# EasyEDA Pro project WT_VCO_open.epro

# Schematic WT VCO

## Sheets
1 P1: Board Name: Board1; Create Date: 2026-09-29; Page Name: P1; Project Name: Dual WT; Schematic Name: Schematic1; Update Date: 2026-09-29; Company: Shota Azuma; Drawn: Shota Azuma; Page Size: A4; Reviewed: Shota Azuma; Version: V1.0
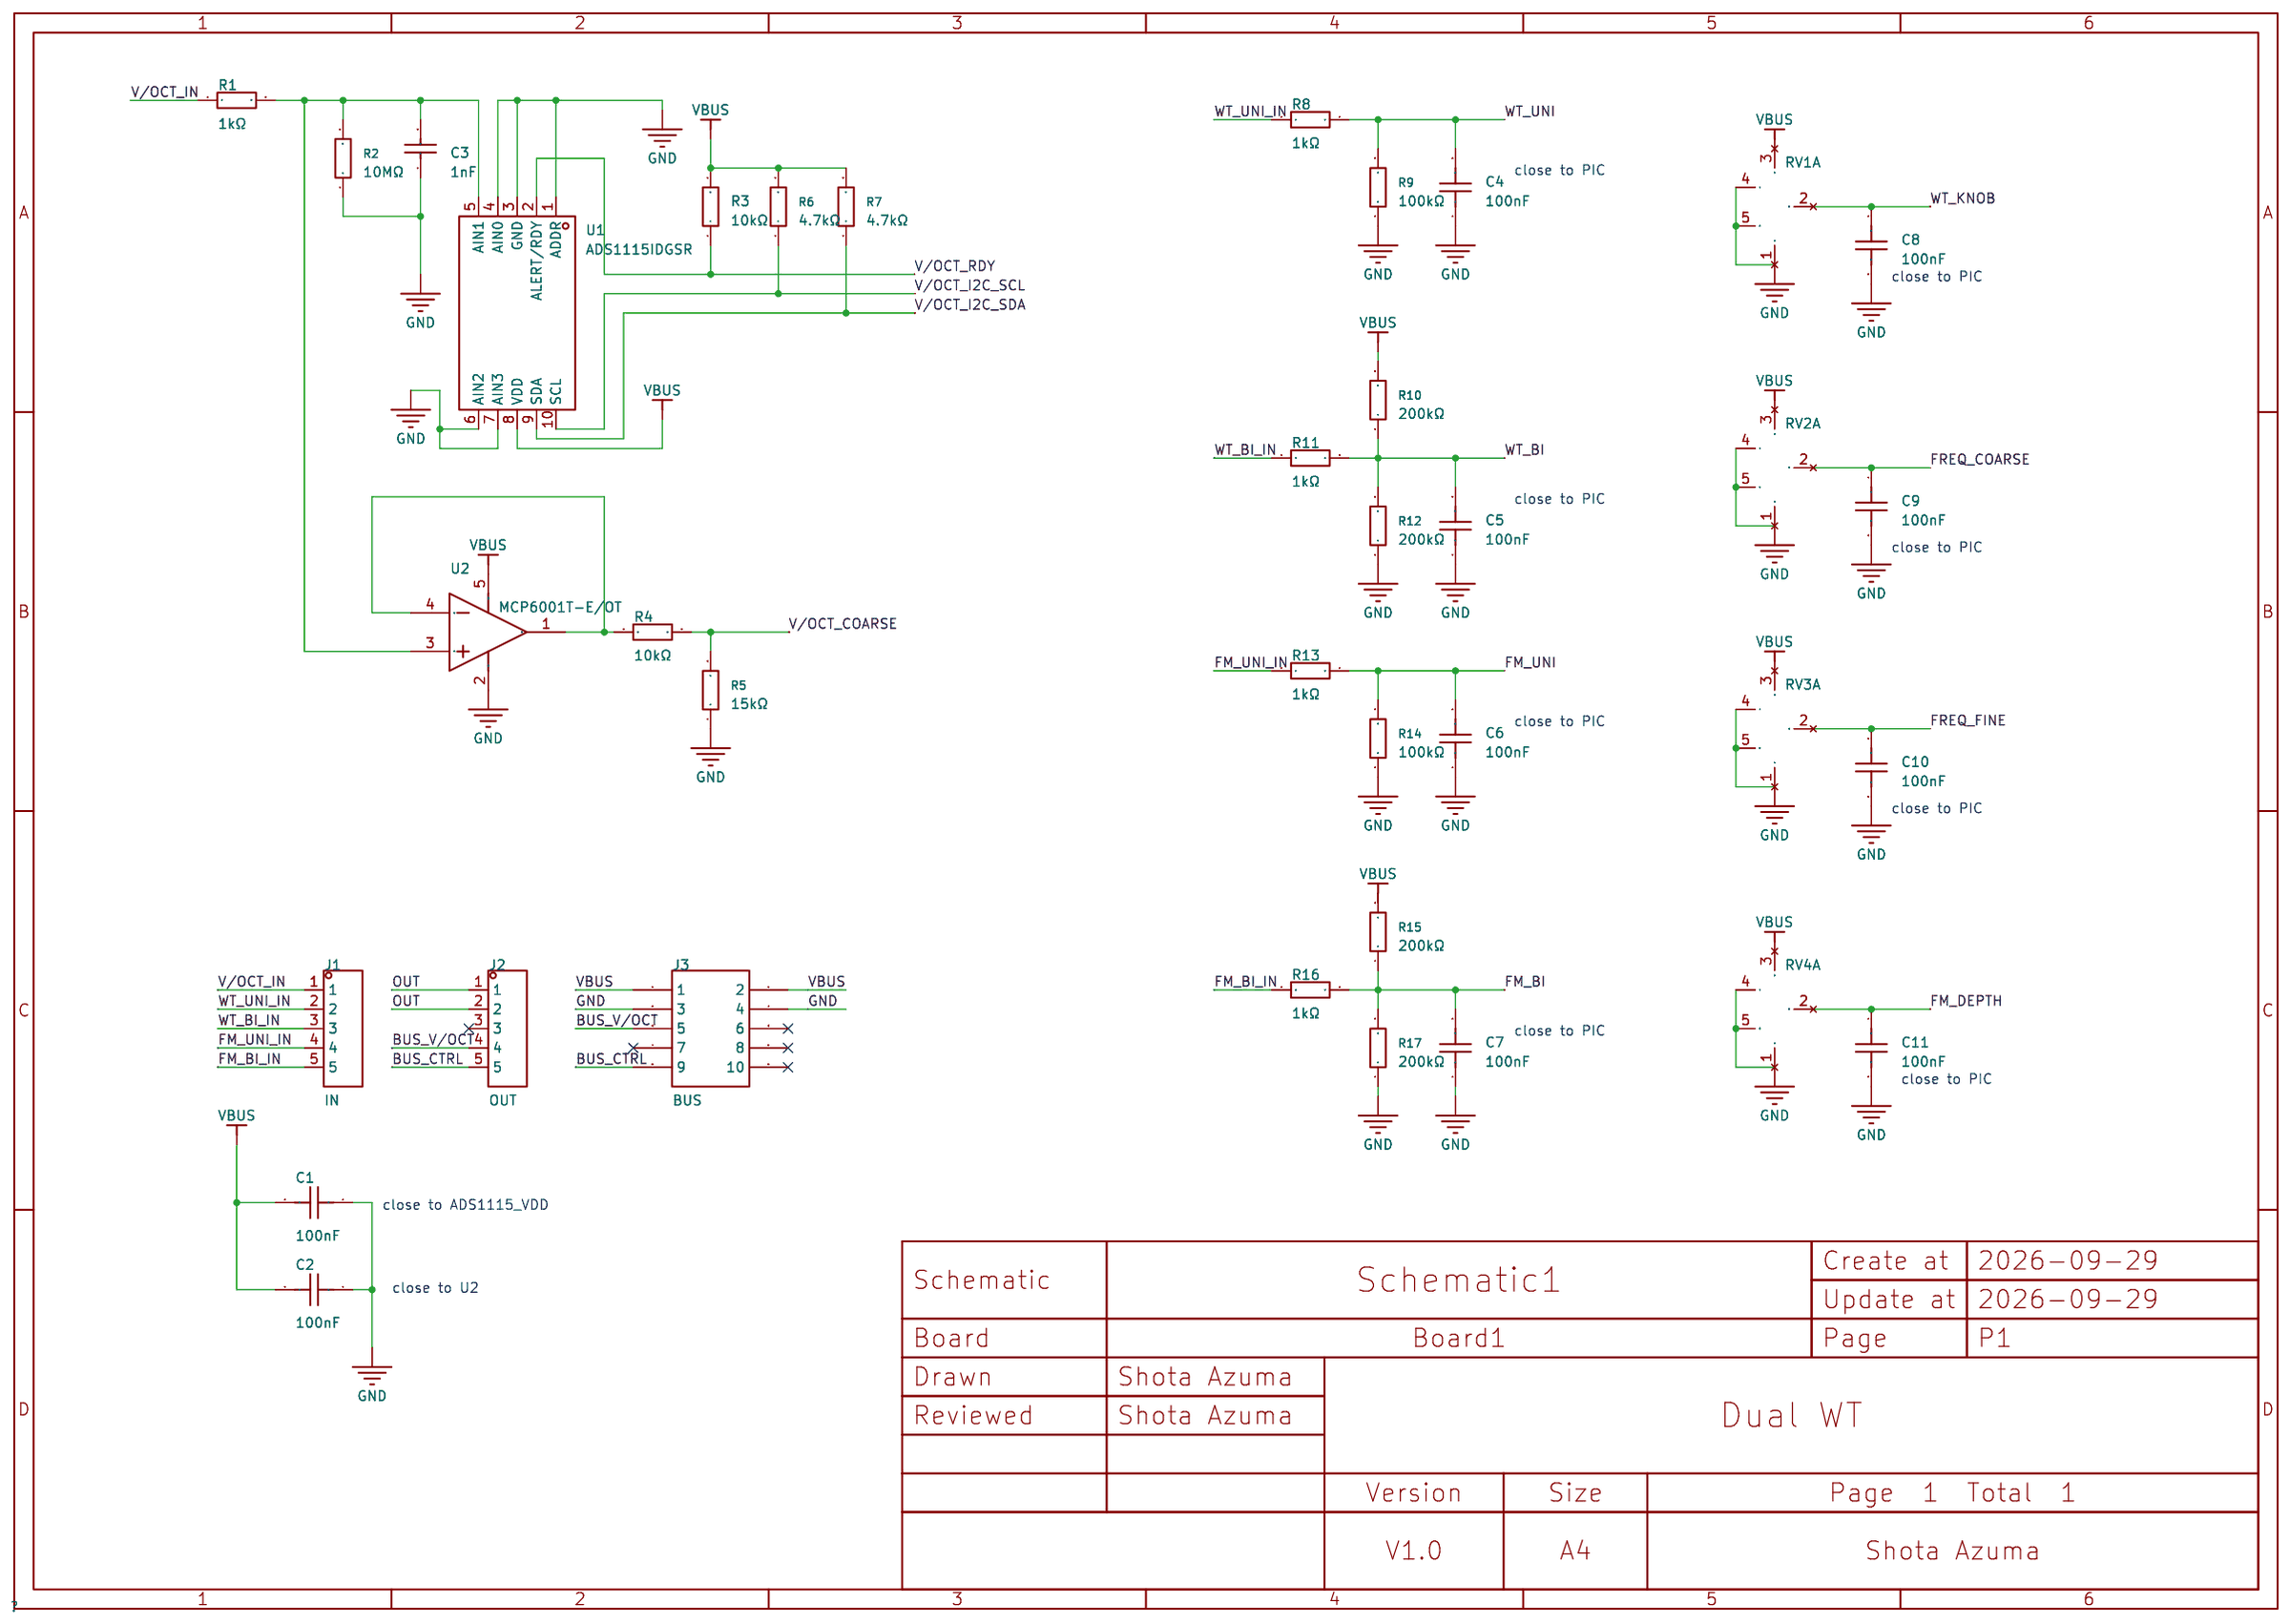
[diagram p0: P1]
2 P2: Page Name: P2
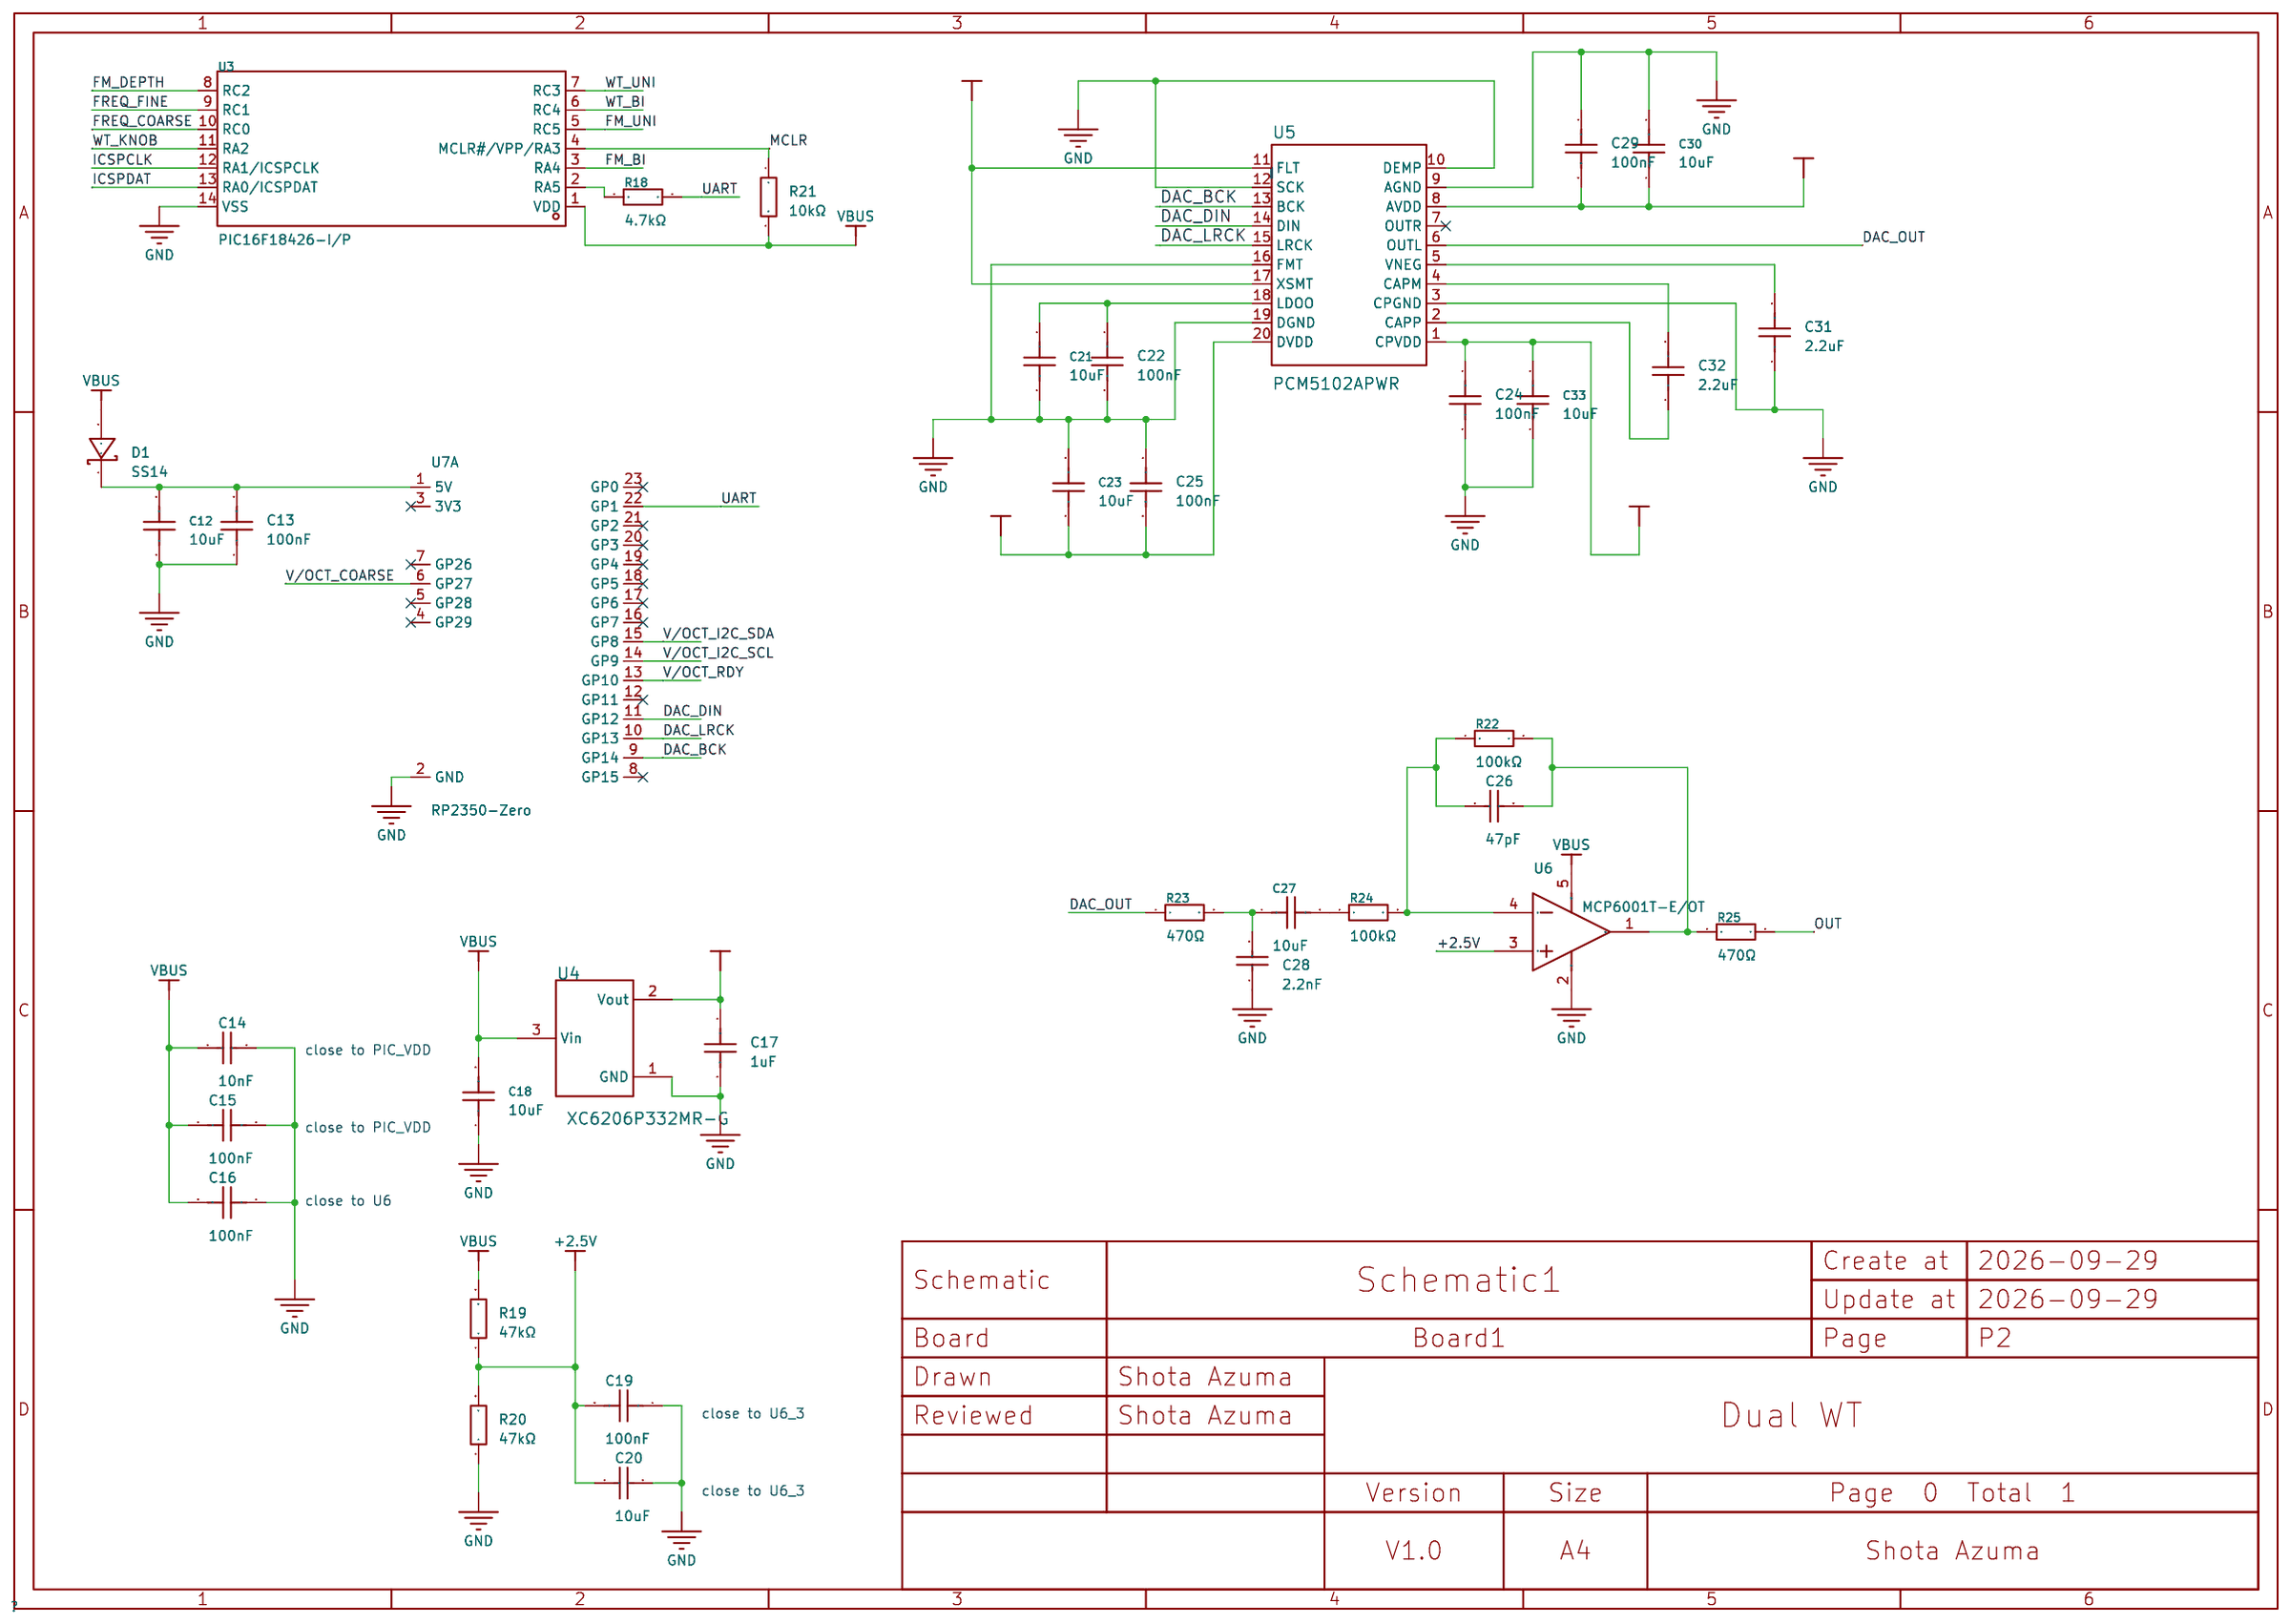
[diagram p1: P2]

## Parts
sheet P1
C1  100nF  [C0402]
C2  100nF  [C0402]
C3  1nF  [C0402]
C4  100nF  [C0402]
C5  100nF  [C0402]
C6  100nF  [C0402]
C7  100nF  [C0402]
C8  100nF  [C0402]
C9  100nF  [C0402]
C10  100nF  [C0402]
C11  100nF  [C0402]
J1  IN  [HDR-TH_5P-P2.54-V-M]  (no BOM)
J2  OUT  [HDR-TH_5P-P2.54-V-M]  (no BOM)
J3  BUS  [HDR-TH_10P-P2.54-V-F-R2-C5-S2.54]  (no BOM)
R1  1kΩ  [R0402]
R2  10MΩ  [R0603]
R3  10kΩ  [R0402]
R4  10kΩ  [R0402]
R5  15kΩ  [R0402]
R6  4.7kΩ  [R0402]
R7  4.7kΩ  [R0402]
R8  1kΩ  [R0402]
R9  100kΩ  [R0402]
R10  200kΩ  [R0402]
R11  1kΩ  [R0402]
R12  200kΩ  [R0402]
R13  1kΩ  [R0402]
R14  100kΩ  [R0402]
R15  200kΩ  [R0402]
R16  1kΩ  [R0402]
R17  200kΩ  [R0402]
RV1  -  [ALPS_RK09K_Vertical]  (section 1)  (no BOM)
RV2  -  [ALPS_RK09K_Vertical]  (section 1)  (no BOM)
RV3  -  [ALPS_RK09K_Vertical]  (section 1)  (no BOM)
RV4  -  [ALPS_RK09K_Vertical]  (section 1)  (no BOM)
U1  ADS1115IDGSR  [MSOP-10_L3.0-W3.0-P0.50-LS5.0-BL]
U2  MCP6001T-E/OT  [SOT-23-5_L3.0-W1.7-P0.95-LS2.8-BR]
sheet P2
C12  10uF  [C0603]
C13  100nF  [C0402]
C14  10nF  [C0402]
C15  100nF  [C0402]
C16  100nF  [C0402]
C17  1uF  [C0402]
C18  10uF  [C0603]
C19  100nF  [C0402]
C20  10uF  [C0402]
C21  10uF  [C0603]
C22  100nF  [C0402]
C23  10uF  [C0603]
C24  100nF  [C0402]
C25  100nF  [C0402]
C26  47pF  [C0402]
C27  10uF  [C0603]
C28  2.2nF  [C0603]
C29  100nF  [C0402]
C30  10uF  [C0603]
C31  2.2uF  [C0805]
C32  2.2uF  [C0805]
C33  10uF  [C0603]
D1  SS14  [SMA_L4.2-W2.6-LS5.0-RD_1]
R18  4.7kΩ  [R0402]
R19  47kΩ  [R0402]
R20  47kΩ  [R0402]
R21  10kΩ  [R0402]
R22  100kΩ  [R0402]
R23  470Ω  [R0402]
R24  100kΩ  [R0402]
R25  470Ω  [R0402]
U3  PIC16F18426-I/P  [PDIP-14_L19.7-W6.6-P2.54-LS8.3-BL]  (no BOM)
U4  XC6206P332MR-G  [SOT-23-3_L2.9-W1.6-P1.90-LS2.8-BR]
U5  PCM5102APWR  [TSSOP-20_L6.5-W4.4-P0.65-LS6.4-BL]
U6  MCP6001T-E/OT  [SOT-23-5_L3.0-W1.7-P0.95-LS2.8-BR]
U7  RP2350-Zero  [RP2350-Zero]  (section 1)  (no BOM)

## Library data of the parts
C1 C2 C4-C11 C13 C15 C16 C19 C22 C24 C25 C29 = CL05B104KB54PNC: Capacitance:100nF Tolerance:±10% Tolerance:±10% Voltage Rating:50V Temperature Coefficient:X7R; LCSC Part Name: 100nF ±10% 50V; Supplier Part: C307331; Manufacturer: SAMSUNG(三星); Supplier Footprint: 0402; JLCPCB Part Class: Basic Part; Datasheet: https://item.szlcsc.com/datasheet/CL05B104KB54PNC/291005.html; Supplier: LCSC; Tolerance: ±10%; Voltage Rating: 50V; Temperature Coefficient: X7R
C3 = 0402B102K500NT: Capacitance:1nF Tolerance:±10% Tolerance:±10% Voltage Rating:50V Temperature Coefficient:X7R; LCSC Part Name: 1nF ±10% 50V; Supplier Part: C1523; Manufacturer: FH(风华); Supplier Footprint: 0402; JLCPCB Part Class: Basic Part; Datasheet: https://item.szlcsc.com/datasheet/0402B102K500NT/1875.html; Supplier: LCSC; Tolerance: ±10%; Voltage Rating: 50V; Temperature Coefficient: X7R
J1 J2 = HDR-M_2.54_1x5P: Supplier Footprint: Through
J3 = HDR-F_2.54_2x5: Supplier Footprint: Through; Supplier Part: HDR-F-2.54_2x5.1
R1 R8 R11 R13 R16 = 0402WGF1001TCE: Type:Thick Film Resistor Resistance:1kΩ Tolerance:±1% Tolerance:±1% Power(Watts):62.5mW Voltage-Supply(Max):50V Temperature Coefficient:±100ppm/℃ Temperature Coefficient:±100ppm/℃ Operating Temperature:-55℃~+155℃ Operating Temperature:-55℃~+155℃; LCSC Part Name: 厚膜电阻 1kΩ ±1%; Supplier Part: C11702; Manufacturer: UNI-ROYAL(厚声); Supplier Footprint: 0402; JLCPCB Part Class: Basic Part; Datasheet: https://item.szlcsc.com/datasheet/0402WGF1001TCE/12256.html; Supplier: LCSC; Type: Thick Film Resistor; Tolerance: ±1%; Power(Watts): 62.5mW; Voltage-Supply(Max): 50V; Temperature Coefficient: ±100ppm/℃; Operating Temperature: -55℃~+155℃
R2 = 0603WAF1005T5E: Type:Thick Film Resistor Resistance:10MΩ Tolerance:±1% Tolerance:±1% Power(Watts):100mW Voltage-Supply(Max):75V Temperature Coefficient:±100ppm/℃ Temperature Coefficient:±100ppm/℃ Operating Temperature:-55℃~+155℃ Operating Temperature:-55℃~+155℃; LCSC Part Name: 厚膜电阻 10MΩ ±1%; Supplier Part: C7250; Manufacturer: UNI-ROYAL(厚声); Supplier Footprint: 0603; JLCPCB Part Class: Basic Part; Datasheet: https://item.szlcsc.com/datasheet/0603WAF1005T5E/7726.html; Supplier: LCSC; Type: Thick Film Resistor; Tolerance: ±1%; Power(Watts): 100mW; Voltage-Supply(Max): 75V; Temperature Coefficient: ±100ppm/℃; Operating Temperature: -55℃~+155℃
R3 R4 R21 = 0402WGF1002TCE: Type:Thick Film Resistor Resistance:10kΩ Tolerance:±1% Tolerance:±1% Power(Watts):62.5mW Voltage-Supply(Max):50V Temperature Coefficient:±100ppm/℃ Temperature Coefficient:±100ppm/℃ Operating Temperature:-55℃~+155℃ Operating Temperature:-55℃~+155℃; LCSC Part Name: 厚膜电阻 10kΩ ±1%; Supplier Part: C25744; Manufacturer: UNI-ROYAL(厚声); Supplier Footprint: 0402; JLCPCB Part Class: Basic Part; Datasheet: https://item.szlcsc.com/datasheet/0402WGF1002TCE/26487.html; Supplier: LCSC; Type: Thick Film Resistor; Tolerance: ±1%; Power(Watts): 62.5mW; Voltage-Supply(Max): 50V; Temperature Coefficient: ±100ppm/℃; Operating Temperature: -55℃~+155℃
R5 = 0402WGF1502TCE: Type:Thick Film Resistors Resistance:15kΩ Tolerance:±1% Tolerance:±1% Power(Watts): Overload Voltage (Max): Temperature Coefficient:±100ppm/℃ Temperature Coefficient:±100ppm/℃ Operating Temperature Range:-55℃~+155℃ Operating Temperature Range:-55℃~+155℃; LCSC Part Name: 15kΩ ±1% 62.5mW 厚膜电阻; Supplier Part: C25756; Manufacturer: UNI-ROYAL(厚声); Supplier Footprint: 0402; JLCPCB Part Class: Basic Part; Datasheet: https://atta.szlcsc.com/upload/public/pdf/source/20200306/C422600_1E6D84923E4A46A82E41ADD87F860B5C.pdf; Supplier: LCSC; Type: Thick Film Resistors; Tolerance: ±1%; Temperature Coefficient: ±100ppm/℃; Operating Temperature Range: -55℃~+155℃
R6 R7 R18 = 0402WGF4701TCE: Type:Thick Film Resistor Resistance:4.7kΩ Tolerance:±1% Tolerance:±1% Power(Watts):62.5mW Voltage-Supply(Max):50V Temperature Coefficient:±100ppm/℃ Temperature Coefficient:±100ppm/℃ Operating Temperature:-55℃~+155℃ Operating Temperature:-55℃~+155℃; LCSC Part Name: 厚膜电阻 4.7kΩ ±1%; Supplier Part: C25900; Manufacturer: UNI-ROYAL(厚声); Supplier Footprint: 0402; JLCPCB Part Class: Basic Part; Datasheet: https://item.szlcsc.com/datasheet/0402WGF4701TCE/26643.html; Supplier: LCSC; Type: Thick Film Resistor; Tolerance: ±1%; Power(Watts): 62.5mW; Voltage-Supply(Max): 50V; Temperature Coefficient: ±100ppm/℃; Operating Temperature: -55℃~+155℃
R9 R14 R22 R24 = 0402WGF1003TCE: Type:Thick Film Resistor Resistance:100kΩ Tolerance:±1% Tolerance:±1% Power(Watts):62.5mW Voltage-Supply(Max):50V Temperature Coefficient:±100ppm/℃ Temperature Coefficient:±100ppm/℃ Operating Temperature:-55℃~+155℃ Operating Temperature:-55℃~+155℃; LCSC Part Name: 厚膜电阻 100kΩ ±1%; Supplier Part: C25741; Manufacturer: UNI-ROYAL(厚声); Supplier Footprint: 0402; JLCPCB Part Class: Basic Part; Datasheet: https://item.szlcsc.com/datasheet/0402WGF1003TCE/26484.html; Supplier: LCSC; Type: Thick Film Resistor; Tolerance: ±1%; Power(Watts): 62.5mW; Voltage-Supply(Max): 50V; Temperature Coefficient: ±100ppm/℃; Operating Temperature: -55℃~+155℃
R10 R12 R15 R17 = 0402WGF2003TCE: Type:Thick Film Resistor Resistance:200kΩ Tolerance:±1% Tolerance:±1% Power(Watts):62.5mW Voltage-Supply(Max):50V Temperature Coefficient:±100ppm/℃ Temperature Coefficient:±100ppm/℃ Operating Temperature:-55℃~+155℃ Operating Temperature:-55℃~+155℃; LCSC Part Name: 200kΩ ±1% 62.5mW 厚膜电阻; Supplier Part: C25764; Manufacturer: UNI-ROYAL(厚声); Supplier Footprint: 0402; JLCPCB Part Class: Basic Part; Datasheet: https://item.szlcsc.com/datasheet/0402WGF2003TCE/26507.html; Supplier: LCSC; Type: Thick Film Resistor; Tolerance: ±1%; Power(Watts): 62.5mW; Voltage-Supply(Max): 50V; Temperature Coefficient: ±100ppm/℃; Operating Temperature: -55℃~+155℃
RV1-RV4 = ALPS_RK09K_Vertical: ALPS ALPINE RK09K series 9mm rotary potentiometer, vertical PCB mount; Manufacturer: ALPS ALPINE
U1 = ADS1115IDGSR: Resolution (Bits):16 Sampling Rate:860Hz number of channels:2 Voltage - Supply:2V~5.5V Voltage - Supply:2V~5.5V Interface:I2C differential input:Yes Integral non - linearity:1LSB Integral non - linearity:1LSB Operating Temperature:-40℃~+125℃ Operating Tem; LCSC Part Name: 具有内部基准、振荡器和可编程比较器且兼容 I2C 的ADS111x、超小型、低功耗 860SPS、16位ADC; Supplier Part: C37593; Manufacturer: TI(德州仪器); Supplier Footprint: VSSOP-10; JLCPCB Part Class: Extended Part; Datasheet: https://www.ti.com/cn/lit/ds/symlink/ads1115.pdf; Supplier: LCSC; Resolution (Bits): 16; Sampling Rate: 860Hz; number of channels: 2; Voltage - Supply: 2V~5.5V; Interface: I2C; differential input: Yes; Integral non - linearity: 1LSB; Operating Temperature: -40℃~+125℃; Clock/Oscillator: Built-in; Voltage Reference: Built-in; Programmable Gain: Support; ADC architecture: Sigma-Delta; Quiescent Current (Iq): 500nA; Features: Integrated modulator；Multiplexers；Built-in digital filter；Power-on reset
U2 U6 = MCP6001T-E/OT: Number of Channels:1 Rail to Rail:Rail-to-Rail Input, Rail-to-Rail Output Gain Bandwidth Product:1MHz Vos - Input Offset Voltage:4.5mV Input Offset Voltage Drift(Vos TC):2uV/℃ Slew Rate:600V/ms Ib - Input Bias Current:1pA Input Offset Current(Ios):1pA Inp; LCSC Part Name: 1 MHz 低功耗运算放大器; Supplier Part: C29429; Manufacturer: MICROCHIP(美国微芯); Supplier Footprint: SOT-23-5; JLCPCB Part Class: Extended Part; Datasheet: https://item.szlcsc.com/datasheet/MCP6001T-E%252FOT/30183.html; Supplier: LCSC; Number of Channels: 1; Rail to Rail: Rail-to-Rail Input, Rail-to-Rail Output; Gain Bandwidth Product: 1MHz; Vos - Input Offset Voltage: 4.5mV; Input Offset Voltage Drift(Vos TC): 2uV/℃; Slew Rate: 600V/ms; Ib - Input Bias Current: 1pA; Input Offset Current(Ios): 1pA; Input Voltage Noise Density: 28nV/√Hz@1kHz; Common Mode Rejection Ratio(CMRR): 76dB; Quiescent Current: 100uA; Output Current: 23mA; Operating Temperature: -40℃~+125℃; Single supply: 1.8V~6V; Features: ESD protection
C12 C18 C21 C23 C27 C30 C33 = CL10A106MA8NRNC: Capacitance:10uF Tolerance:±20% Tolerance:±20% Voltage Rating:25V Temperature Coefficient:X5R; LCSC Part Name: 10uF ±20% 25V; Supplier Part: C96446; Manufacturer: SAMSUNG(三星); Supplier Footprint: 0603; JLCPCB Part Class: Basic Part; Datasheet: https://item.szlcsc.com/datasheet/CL10A106MA8NRNC/97651.html; Supplier: LCSC; Tolerance: ±20%; Voltage Rating: 25V; Temperature Coefficient: X5R
C14 = CL05B103KB5NNNC: Capacitance:10nF Tolerance:±10% Tolerance:±10% Voltage Rating:50V Temperature Coefficient:X7R; LCSC Part Name: 10nF ±10% 50V; Supplier Part: C15195; Manufacturer: SAMSUNG(三星); Supplier Footprint: 0402; JLCPCB Part Class: Basic Part; Datasheet: https://item.szlcsc.com/datasheet/CL05B103KB5NNNC/15869.html; Supplier: LCSC; Tolerance: ±10%; Voltage Rating: 50V; Temperature Coefficient: X7R
C17 = CL05A105KA5NQNC: Capacitance:1uF Tolerance:±10% Tolerance:±10% Voltage Rating:25V Temperature Coefficient:X5R; LCSC Part Name: 1uF ±10% 25V; Supplier Part: C52923; Manufacturer: SAMSUNG(三星); Supplier Footprint: 0402; JLCPCB Part Class: Basic Part; Datasheet: https://item.szlcsc.com/datasheet/CL05A105KA5NQNC/53938.html; Supplier: LCSC; Tolerance: ±10%; Voltage Rating: 25V; Temperature Coefficient: X5R
C20 = CL05A106MQ5NUNC: Capacitance:10uF Tolerance:±20% Tolerance:±20% Voltage Rating:6.3V Temperature Coefficient:X5R; LCSC Part Name: 10uF ±20% 6.3V; Supplier Part: C15525; Manufacturer: SAMSUNG(三星); Supplier Footprint: 0402; JLCPCB Part Class: Basic Part; Datasheet: https://item.szlcsc.com/datasheet/CL05A106MQ5NUNC/16204.html; Supplier: LCSC; Tolerance: ±20%; Voltage Rating: 6.3V; Temperature Coefficient: X5R
C26 = 0402CG470J500NT: Capacitance:47pF Tolerance:±5% Tolerance:±5% Voltage Rating:50V Temperature Coefficient:C0G; LCSC Part Name: 47pF ±5% 50V; Supplier Part: C1567; Manufacturer: FH(风华); Supplier Footprint: 0402; JLCPCB Part Class: Basic Part; Datasheet: https://item.szlcsc.com/datasheet/0402CG470J500NT/1919.html; Supplier: LCSC; Tolerance: ±5%; Voltage Rating: 50V; Temperature Coefficient: C0G
C28 = 0603B222K500NT: Capacitance:2.2nF Tolerance:±10% Tolerance:±10% Voltage Rating:50V Temperature Coefficient:X7R; LCSC Part Name: 2.2nF ±10% 50V; Supplier Part: C1604; Manufacturer: FH(风华); Supplier Footprint: 0603; JLCPCB Part Class: Basic Part; Datasheet: https://item.szlcsc.com/datasheet/0603B222K500NT/1956.html; Supplier: LCSC; Tolerance: ±10%; Voltage Rating: 50V; Temperature Coefficient: X7R
C31 C32 = CL21A225KBQNNNE: Capacitance:2.2uF Tolerance:±10% Tolerance:±10% Voltage Rating:50V Temperature Coefficient:X5R; LCSC Part Name: 2.2uF ±10% 50V; Supplier Part: C377773; Manufacturer: SAMSUNG(三星); Supplier Footprint: 0805; JLCPCB Part Class: Basic Part; Datasheet: https://item.szlcsc.com/datasheet/CL21A225KBQNNNE/350246.html; Supplier: LCSC; Tolerance: ±10%; Voltage Rating: 50V; Temperature Coefficient: X5R
D1 = SS14_C2480: Diode Configuration:Independent Voltage - Forward(Vf@If):550mV@1A Voltage - DC Reverse(Vr):40V Current - Rectified:1A Reverse Leakage Current (Ir):300uA@40V Operating Junction Temperature Range:-55℃~+150℃ Operating Junction Temperature Range:-55℃~+150℃ No; LCSC Part Name: 电压:40V 电流:1A; Supplier Part: C2480; Manufacturer: MDD(辰达半导体); Supplier Footprint: SMA(DO-214AC); JLCPCB Part Class: Basic Part; Datasheet: https://item.szlcsc.com/datasheet/SS14/2857.html; Supplier: LCSC; Diode Configuration: Independent; Voltage - Forward(Vf@If): 550mV@1A; Voltage - DC Reverse(Vr): 40V; Current - Rectified: 1A; Reverse Leakage Current (Ir): 300uA@40V; Operating Junction Temperature Range: -55℃~+150℃; Non-Repetitive Peak Forward Surge Current: 25A
R19 R20 = 0402WGF4702TCE: Type:Thick Film Resistor Resistance:47kΩ Tolerance:±1% Tolerance:±1% Power(Watts):62.5mW Voltage-Supply(Max):50V Temperature Coefficient:±100ppm/℃ Temperature Coefficient:±100ppm/℃ Operating Temperature:-55℃~+155℃ Operating Temperature:-55℃~+155℃; LCSC Part Name: 厚膜电阻 47kΩ ±1%; Supplier Part: C25792; Manufacturer: UNI-ROYAL(厚声); Supplier Footprint: 0402; JLCPCB Part Class: Basic Part; Datasheet: https://item.szlcsc.com/datasheet/0402WGF4702TCE/26535.html; Supplier: LCSC; Type: Thick Film Resistor; Tolerance: ±1%; Power(Watts): 62.5mW; Voltage-Supply(Max): 50V; Temperature Coefficient: ±100ppm/℃; Operating Temperature: -55℃~+155℃
R23 R25 = 0402WGF4700TCE: Type:Thick Film Resistor Resistance:470Ω Tolerance:±1% Tolerance:±1% Power(Watts):62.5mW Voltage-Supply(Max):50V Temperature Coefficient:±100ppm/℃ Temperature Coefficient:±100ppm/℃ Operating Temperature:-55℃~+155℃ Operating Temperature:-55℃~+155℃; LCSC Part Name: 厚膜电阻 470Ω ±1%; Supplier Part: C25117; Manufacturer: UNI-ROYAL(厚声); Supplier Footprint: 0402; JLCPCB Part Class: Basic Part; Datasheet: https://item.szlcsc.com/datasheet/0402WGF4700TCE/25860.html; Supplier: LCSC; Type: Thick Film Resistor; Tolerance: ±1%; Power(Watts): 62.5mW; Voltage-Supply(Max): 50V; Temperature Coefficient: ±100ppm/℃; Operating Temperature: -55℃~+155℃
U3 = PIC16F18426-I/P: CPU Core:PIC CPU Maximum Speed:32MHz Core Size:8 Bit Program Storage Size:28KB Program Memory Type:FLASH RAM Size:2KB EEPROM:256Byte Number of I/O:12 ADC (Bit):12bit DAC (Bit):5bit Oscillator Type:Built-in Voltage - Supply:2.3V~5.5V Voltage - Supply:2.3V~; LCSC Part Name: 14/20引脚全功能、低引脚数微控制器，具备XLP; Supplier Part: PIC16F18426-I/P.1; Manufacturer: MICROCHIP(美国微芯); Supplier Footprint: PDIP-14; JLCPCB Part Class: Extended Part; Datasheet: https://item.szlcsc.com/datasheet/PIC16F18426-I%252FP/675335.html; Supplier: LCSC; CPU Core: PIC; CPU Maximum Speed: 32MHz; Core Size: 8 Bit; Program Storage Size: 28KB; Program Memory Type: FLASH; RAM Size: 2KB; EEPROM: 256Byte; Number of I/O: 12; ADC (Bit): 12bit; DAC (Bit): 5bit; Oscillator Type: Built-in; Voltage - Supply: 2.3V~5.5V; Operating Temperature: -40℃~+85℃
U4 = XC6206P332MR: Output Configuration:Positive Voltage - Supply:6V Output Voltage:3.3V Output Voltage:3.3V Output Current:200mA Power Supply Rejection Ratio (PSRR):- Voltage Dropout:- standby current:1uA Noise:- Features:Short Circuit Protection；Over Current Protection Op; Supplier: LCSC; Manufacturer: TOREX(特瑞仕); Supplier Part: C5446; JLCPCB Part Class: Basic Part; Origin 3D Model Title: SOT-23-3L_L2.9-W1.6-H1.1-LS2.8-P0.95
U5 = PCM5102APWR: Resolution (Bits):32 Number of Channels:2 Voltage - Supply:1.8V~3.3V Voltage - Supply:1.8V~3.3V Interface Type:I2S The Chip Type:Audio Decoder Operating Temperature:-25℃~+85℃ Operating Temperature:-25℃~+85℃ Sampling Rate:384kHz Quiescent Current (Iq):500u; Supplier: LCSC; Manufacturer: TI(德州仪器); Supplier Part: C107671; JLCPCB Part Class: Extended Part; Origin 3D Model Title: TSSOP-20_L6.5-W4.4-H1.0-LS6.4-P0.65
U7 = RP2350-Zero: Waveshare RP2350-Zero (RP2350A, 23 castellated pins); Supplier Part: 57fc076eeeed5b41

## Nets
+2.5V: C19.2 C20.2 R19.1 R20.2 U6.3(VIN+)
+3.3V: C17.1 C23.1 C24.1 C25.2 C29.2 C30.1 C33.2 U4.2(Vout) U5.1(CPVDD) U5.8(AVDD) U5.11(FLT) U5.17(XSMT) U5.20(DVDD)
GND: C1.1 C2.1 C3.1 C4.1 C5.1 C6.1 C7.1 C8.2 C9.2 C10.2 C11.2 C12.1 C13.1 C14.2 C15.2 C16.1 C17.2 C18.1 C19.1 C20.1 C21.1 C22.2 C23.2 C24.2 C25.1 C28.1 C29.1 C30.2 C31.1 C33.1 J3.3 J3.4 R2.1 R5.1 R9.1 R12.1 R14.1 R17.1 R20.1 RV1.1 RV1.4 RV1.5 RV2.1 RV2.4 RV2.5 RV3.1 RV3.4 RV3.5 RV4.1 RV4.4 RV4.5 U1.1(ADDR) U1.3(GND) U1.4(AIN0) U1.6(AIN2) U1.7(AIN3) U2.2(VSS) U3.14(VSS) U4.1(GND) U5.3(CPGND) U5.9(AGND) U5.10(DEMP) U5.12(SCK) U5.16(FMT) U5.19(DGND) U6.2(VSS) U7.2(GND)
VBUS: C1.2 C2.2 C14.1 C15.1 C16.2 C18.2 D1.2(A) J3.1 J3.2 R3.2 R6.2 R7.2 R10.2 R15.2 R19.2 R21.2 RV1.3 RV2.3 RV3.3 RV4.3 U1.8(VDD) U2.5(VDD) U3.1(VDD) U4.3(Vin) U6.5(VDD)
BUS_CTRL: J2.5 J3.9
BUS_V/OCT: J2.4 J3.5
DAC_BCK: U5.13(BCK) U7.9(GP14)
DAC_DIN: U5.14(DIN) U7.11(GP12)
DAC_LRCK: U5.15(LRCK) U7.10(GP13)
DAC_OUT: R23.1 U5.6(OUTL)
FM_BI: C7.2 R15.1 R16.2 R17.2 U3.3(RA4)
FM_BI_IN: J1.5 R16.1
FM_DEPTH: C11.1 RV4.2 U3.8(RC2)
FM_UNI: C6.2 R13.2 R14.2 U3.5(RC5)
FM_UNI_IN: J1.4 R13.1
FREQ_COARSE: C9.1 RV2.2 U3.10(RC0)
FREQ_FINE: C10.1 RV3.2 U3.9(RC1)
ICSPCLK: U3.12(RA1/ICSPCLK)
ICSPDAT: U3.13(RA0/ICSPDAT)
MCLR: R21.1 U3.4(MCLR#/VPP/RA3)
OUT: J2.1 J2.2 R25.2
UART: R18.2 U7.22(GP1)
V/OCT_COARSE: R4.2 R5.2 U7.6(GP27)
V/OCT_I2C_SCL: R6.1 U1.10(SCL) U7.14(GP9)
V/OCT_I2C_SDA: R7.1 U1.9(SDA) U7.15(GP8)
V/OCT_IN: J1.1 R1.1
V/OCT_RDY: R3.1 U1.2(ALERT/RDY) U7.13(GP10)
WT_BI: C5.2 R10.1 R11.2 R12.2 U3.6(RC4)
WT_BI_IN: J1.3 R11.1
WT_KNOB: C8.1 RV1.2 U3.11(RA2)
WT_UNI: C4.2 R8.2 R9.2 U3.7(RC3)
WT_UNI_IN: J1.2 R8.1
Net-(C3-2): C3.2 R1.2 R2.2 U1.5(AIN1) U2.3(VIN+)
Net-(C12-2): C12.2 C13.2 D1.1(K) U7.1(5V)
Net-(C21-2): C21.2 C22.1 U5.18(LDOO)
Net-(C26-1): C26.1 R22.1 R24.2 U6.4(VIN-)
Net-(C26-2): C26.2 R22.2 R25.1 U6.1(VOUT)
Net-(C27-1): C27.1 C28.2 R23.2
Net-(C27-2): C27.2 R24.1
Net-(C31-2): C31.2 U5.5(VNEG)
Net-(C32-1): C32.1 U5.2(CAPP)
Net-(C32-2): C32.2 U5.4(CAPM)
Net-(R4-1): R4.1 U2.1(VOUT) U2.4(VIN-)
Net-(R18-1): R18.1 U3.2(RA5)

Not connected (* = marked no-connect by the designer): J2 3*; J3 6* 7* 8* 10*; U5 7(OUTR)*; U7 3(3V3)* 4(GP29)* 5(GP28)* 7(GP26)* 8(GP15)* 12(GP11)* 16(GP7)* 17(GP6)* 18(GP5)* 19(GP4)* 20(GP3)* 21(GP2)* 23(GP0)*

## Notes on the sheets
sheet 1
- close to PIC
- close to PIC
- close to PIC
- close to PIC
- close to PIC
- close to PIC
- close to PIC
- close to PIC
- close to ADS1115_VDD
- close to U2
sheet 2
- close to PIC_VDD
- close to PIC_VDD
- close to U6
- close to U6_3
- close to U6_3
